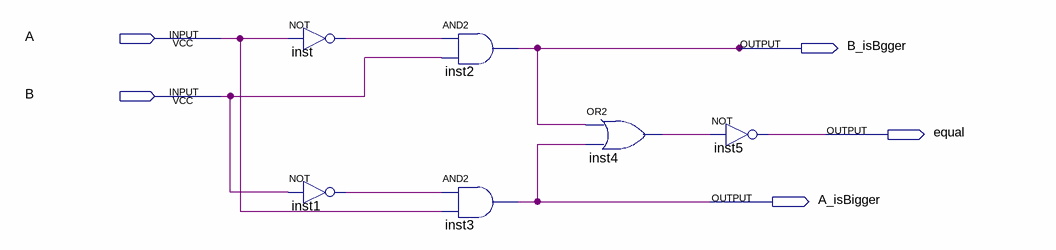
[diagram p0: schematic sheet]
// Quartus schematic compare_1.bdf as structural Verilog: 6 symbols, 5 pins
module compare_1 (
  input  A,
  input  B,
  output B_isBgger,
  output equal,
  output A_isBigger
);

  wire inst1_out, inst4_out, inst_out;

  not inst (inst_out, A);
  not inst1 (inst1_out, B);
  and inst2 (B_isBgger, inst_out, B);
  and inst3 (A_isBigger, inst1_out, A);
  or inst4 (inst4_out, B_isBgger, A_isBigger);
  not inst5 (equal, inst4_out);
endmodule
